# Altium project QKD-LD-001.PrjPcb
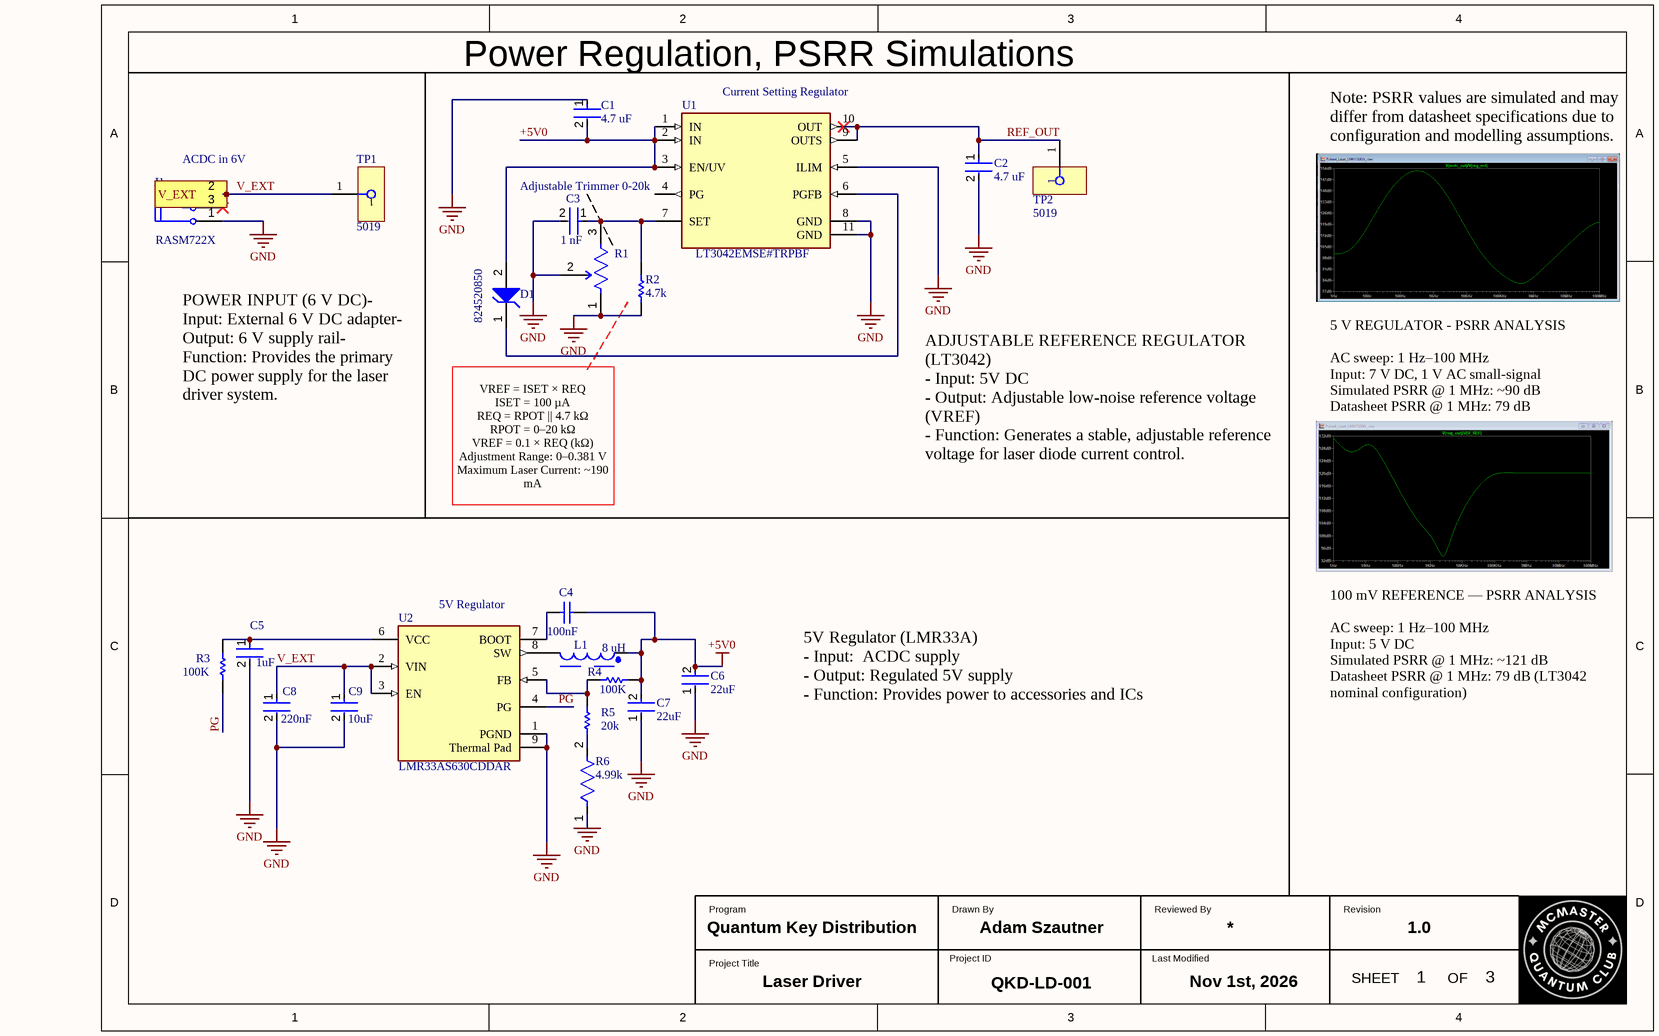
[diagram p0: Power Regulation.SchDoc]
Revision: 1.0; Prj: Laser Driver; Prg: Quantum Key Distribution; PN: QKD-LD-001; LastMod: Nov 1st, 2026; DrawnBy: Adam Szautner
3 sheets, 50 parts. Net scope: global (net labels, ports and power ports of the same name join across sheets).
Sheets:
  Power Regulation.SchDoc
  Pulse Generation.SchDoc
  Peripherals.SchDoc

## Sheet Power Regulation.SchDoc
size A4; DrawnBy: Adam Szautner; Revision: 1.0; SheetNumber: 1; SheetTotal: 3; prg: Quantum Key Distribution; prj: Laser Driver; PN: QKD-LD-001; SPICEModelCacheNLWIOUNF: <root> / <DocumentId>NLWIOUNF</DocumentId> / <CacheFrame Number="0"> / <Model Name="emk325b7475_nht" Kind="CKT"> / <Text>* EMK325B7475_NHT     SPICE MODEL  ( General Type ) / *-------------------------------------------------------------------------------------------------------- / * Model Generated by TAIYO YUDEN Corporation (http://www.ty-top.com) / * Version 1.0 / * TAIYO YUDEN Control No. 170613 / * Copyright(c) 2017 TAIYO YUDEN CO.,LTD. All Rights Reserved. / *-------------------------------------------------------------------------------------------------------- / * / * Products Name : Multilayer Ceramic Capacitors / * / * Characteristics : / *     Capacitance : 4.7 uF , Rated Voltage : 16V , TCC : X7R / *     Case Size : 3.2 x 2.5 / 0.126 x 0.098 [mm/inch] , Thickness : 1.9 / 0.075 [mm/inch] / *     (Conditions: Temperature = 25 degC , DC Bias Current/Voltage = 0A / 0V) / * / * Frequency Range : 40Hz - 3GHz / * / * External Node Assignments : / * / *  1  o---| |---o  2 / * / *-------------------------------------------------------------------------------------------------------- / .SubCkt EMK325B7475_NHT 1 2 / **************************** / C0 1 110 4.4322u / Cm 1 101 0.18549u / C1 101 102 0.5166u / Rc1 101 102 1.212k / C2 102 103 0.23246u / Rc2 102 103 324.4 / C3 103 110 0.044161u / Rc3 103 110 17.632 / C2m 1 301 0.22169u / C21 301 302 1.4263u / Rc21 301 302 2.8865k / C22 302 303 0.94554u / Rc22 302 303 3.6708k / C23 303 304 0.89694u / Rc23 303 304 3.8182k / C24 304 305 0.63775u / Rc24 304 305 327.79 / C25 305 306 0.52201u / Rc25 305 306 313.07 / C26 306 307 0.23625u / Rc26 306 307 60.171 / C27 307 308 0.21382u / Rc27 307 308 30.452 / C28 308 309 0.12573u / Rc28 308 309 51.023 / C29 309 110 4272.8p / Rc29 309 110 13.367 / Rp0 1 110 106.382978723404Meg / L0 110 120 0.15544n / Lm 120 130 0.41806n / L1 120 121 0.46753n / RL1 121 130 0.26517 / L2 120 122 0.47905n / RL2 122 130 0.25841 / L3 120 123 0.81633n / RL3 123 130 40.755 / CR 120 124 1.2488u / LR 124 125 0.3236n / RR 125 130 24.837m / CL 130 140 3.3935p / LL 130 140 0.14146n / RL 130 140 14.873 / Rs 140 2 4.0745m / **************************** / .ends EMK325B7475_NHT</Text> / </Model> / </CacheFrame> / </root>

### Parts
C1  4.7 uF  [FP-1210-L_3_2_0_3-W_2_5_0-MFG]
C2  4.7 uF  [FP-1210-L_3_2_0_3-W_2_5_0-MFG]
C3  1 nF  [FP-0201-L_0_6_0_03-W_0_3-IPC_C]
C4  100nF  [CAPC2013X145X50LL20T20]
C5  1uF  [FP-0402-L_1_0_0_05-W_0_5-IPC_B]
C6  22uF  [FP-GCM32E-0_35-e0_3_1_275-MFG]
C7  22uF  [FP-GCM32E-0_35-e0_3_1_275-MFG]
C8  220nF  [FP-C0603C-CF-MFG]
C9  10uF  [FP-GCJ31C-0_4-IPC_C]
D1  824520850  [WE-TVSP_DO-214AA_Unidirectional]
J1  RASM722X  [SWIT-RASM722X_V]
L1  8 uH  [WE-XHMI_1060 P]
R1  Adjustable Trimmer 0-20k  [FP-3269W-MFG]
R2  4.7k  [RESC1609X50X30NL10T20]
R3  100K  [RESC0603(1608)_N]
R4  100K  [RESC0603(1608)_N]
R5  20k  [RESC3116X65X40ML10T20]
R6  4.99k  [FP-CRCW1210-e3-IPC_B]
TP1  5019  [5019_MFG]
TP2  5019  [5019_MFG]
U1  LT3042EMSE#TRPBF  [FP-MSE-10-05-08-1664-IPC_A]
U2  LMR33AS630CDDAR  [FP-DDA0008J-IPC_B]

### Ports
V_EXT (in)

### Nets
+5V0: C1.2 C4.1 C6.2 C7.2 D1.2(A) L1.1 R4.2 U1.1(IN) U1.2(IN) U1.3(EN/UV)
GND: C1.1 C2.2 C3.2 C5.2 C6.1 C7.1 C8.2 C9.2 J1.1(SLEEVE) R1.1(CCW) R1.2(WIPER) R2.1 R6.1 U1.5(ILIM) U1.8(GND) U1.11(GND) U2.1(PGND) U2.9(Thermal_Pad)
PG: R3.1 U2.4(PG)
REF_OUT: C2.1 TP2.1 U1.9(OUTS) U1.10(OUT)
V_EXT: C8.1 C9.1 J1.2(TIP) TP1.1 U2.2(VIN) U2.3(EN) ; port V_EXT
NetC3_1: C3.1 R1.3(CW) R2.2 U1.7(SET)
NetC4_2: C4.2 U2.7(BOOT)
NetC5_1: C5.1 R3.2 U2.6(VCC)
NetD1_1: D1.1(K) U1.6(PGFB)
NetL1_2: L1.2 U2.8(SW)
NetR4_1: R4.1 R5.2 U2.5(FB)
NetR5_1: R5.1 R6.2

Not connected (* = marked no-connect by the designer): J1 3(SHUNT)*; U1 4(PG)

### Notes on the sheet
- Power Regulation, PSRR Simulations
- (near U1) Current Setting Regulator
- (near J1) ACDC in 6V
- Note: PSRR values are simulated and may differ from datasheet specifications due to configuration and modelling assumptions.
- POWER INPUT (6 V DC)- Input: External 6 V DC adapter- Output: 6 V supply rail- Function: Provides the primary DC power supply for the laser driver system.
- 5 V REGULATOR - PSRR ANALYSIS
  AC sweep: 1 Hz–100 MHz
  Input: 7 V DC, 1 V AC small-signal
  Simulated PSRR @ 1 MHz: ~90 dB
  Datasheet PSRR @ 1 MHz: 79 dB
- VREF = ISET × REQ
  ISET = 100 µA
  REQ = RPOT || 4.7 kΩ
  RPOT = 0–20 kΩ
  VREF = 0.1 × REQ (kΩ)
  Adjustment Range: 0–0.381 V
  Maximum Laser Current: ~190 mA
- ADJUSTABLE REFERENCE REGULATOR (LT3042)
  - Input: 5V DC
  - Output: Adjustable low-noise reference voltage (VREF)
  - Function: Generates a stable, adjustable reference voltage for laser diode current control.
- (near U2) 5V Regulator
- 100 mV REFERENCE — PSRR ANALYSIS
  AC sweep: 1 Hz–100 MHz
  Input: 5 V DC
  Simulated PSRR @ 1 MHz: ~121 dB
  Datasheet PSRR @ 1 MHz: 79 dB (LT3042 nominal configuration)
- 5V Regulator (LMR33A)
  - Input:  ACDC supply
  - Output: Regulated 5V supply
  - Function: Provides power to accessories and ICs
- Program
- Drawn By
- Reviewed By
- Revision
- Project Title
- Project ID
- Last Modified
- SHEET
- OF

### Library data of the parts
C1 C2 = CMP-14477-002952-2: None; RoHS Compliant: Yes
C3 = CMP-14477-001812-1: Ceramic Capacitor General Use 1000pF ±20% 10V X7R 0201
C4 = CMP-2007-01396-1: Part Number: VJ0805Y104JXXPW1BC; Manufacturer: Vitramon
C5 = CMP-14477-002459-2: None
C6 C7 = CMP-06035-055667-1: Ceramic Capacitor for Automotive 22uF ±10% 25VDC X8L 1210 Embossed T/R
C8 = CMP-03020-026996-1: C0603 0.22 μF X7R 30ppm/°C 10.00% 10 V; Manufacturer Part Number: C0603C224K8RAC; Manufacturer: KEMET; Capacitance: 0.22 μF; Automotive Grade: Grade 1; Material: Ceramic; Value: 0.22 μF; Voltage Rating: 10 V; Tolerance: 0.1; Device Class L2: Capacitors; Temperature Range High: +125°C; RoHS: TRUE; Device Class L1: Passive Components; Temperature: -55°C to +125°C; Temperature Coefficient: 30ppm/°C; ComponentLink2Description: Datasheet; Device Class L3: Ceramic Capacitors; ComponentLink2URL: https://api.kemet.com/component-edge/download/datasheet/C0603C100J5GACAUTO.pdf; Category: Cap; Lead Free: Yes; Automotive: Yes; Height: 0.87mm; Temperature Characteristic: X7R; Mouser Description: Multilayer Ceramic Capacitors MLCC - SMD/SMT 50volts 0.22 uF C0G X7R; Octopart: https://octopart.com/c0603c224k8rac-kemet-7455784; Package: C0603C-CF; Temperature Range Low: -55°C
C9 = CMP-06035-004889-1: Cap Ceramic 10uF 35V X7T 10% SMD 1206 +125°C Embossed Plastic T/R
D1 = CMP-03913-71101611-2: Tvs Diode, 600W, 8.5V, Unidir, Do-214Aa; Max Breakdown Voltage: 9.92V; Leakage Current: 20µA; Number of Unidirectional Channels: 1; Polarity: Unidirectional; Peak Pulse Current: 41.7A; Clamping Voltage: 14.4V; Power Line Protection: No; Packaging: Cut Tape; Min Operating Temperature: -65°C; Reverse Standoff Voltage: 8.5V; Max Operating Temperature: 150°C; Composition: Zener; RoHS: Compliant; Width: 3.62mm; Length: 4.32mm; Peak Pulse Power: 600W; Min Breakdown Voltage: 9.92V; REACH SVHC: Unknown; Number of Pins: 2; Mount: Surface Mount; Height: 2.4mm
J1 = CMP-1772-00002-1: Power Jack, 5 A, 250 V, 3-Pin SMD, RoHS, Bulk; ComponentLink1URL: http://www.switchcraft.com/; ComponentLink2URL: http://www.switchcraft.com/Drawings/rasm732x_cd.pdf; ComponentLink1Description: Manufacturer URL; PackageReference: RASM722X; ComponentLink2Description: Datasheet; DatasheetVersion: Rev. A, 09/2005; PackageDescription: 3-Pin Surface Mount Device, Body 14.5 x 9 mm
L1 = CMP-03913-166631046-1: Smd Pwr Ind, 8.2Uh, 19.4A, Shielded/4540 Rohs Compliant: Yes
R1 = CMP-07234-000026-1: TRIMMER 200 OHM 0.25W GW TOP ADJ; Power Rating: 250mW; Temperature Coefficient: 100ppm/°C; Tolerance: 10%; Number of Turns: 12; Resistance: 200R; Packaging: Tape and Reel; Military Standard: Not; Length: 6.35mm; Package Quantity: 1; RoHS Compliant: Yes; Radiation Hardening: No; Height: 0.293inch; Max Power Dissipation: 250mW; Series: Trimpot® 3269 - Sealed; Resistor Type: Cermet; Mount: Surface Mount; Technology: CERMET; Min Operating Temperature: -65°C; Weight: 0.425g; Max Operating Temperature: 150°C; Taper: Linear; Depth: 6.36mm; Width: 0.17inch; Termination: Gull Wing
R2 = CMP-2000-03412-1: Manufacturer: Vishay Dale; Part Number: CRCW06034K70FKTA
R3 R4 = CMP-1012-00736-1: 100K 0.1W 1% 0603 (1608 Metric)  SMD; Value: 100000.00 Ohm; Case-Metric: 1608; Case-EIA: 0603; Power: 0.1 W; Tolerance: 1 %; Technology: SMT
R5 = CMP-2003-04939-1: Part Number: RC1206FR-1320KL; Manufacturer: Yageo
R6 = CMP-2005-00078-2: RES SMD 205K OHM 1% 1/2W 2088; Max Power Dissipation: 500mW; Voltage Rating: 200V; Resistance: 4.99kR; Temperature Coefficient: 100ppm/°C; Case Code (Imperial): 1210; Weight: 0.000564oz; Length: 0.126inch; Case Code (Metric): 3225; Lead Free: Lead Free; Features: Automotive AEC-Q200; Case/Package: 1210; Height: 0.024inch; Number of Terminations: 2; Number of Pins: 2; Composition: Thick Film; Max Operating Temperature: 155°C; Min Operating Temperature: -55°C; Width: 2.5mm; Voltage Rating (DC): 200V; Termination: SMD/SMT; Package Quantity: 1; Power Rating: 500mW; Tolerance: 1%; Packaging: Tape and Reel; Contact Plating: Tin
TP1 TP2 = CMP-1672-00008-3: Phosphor Bronze Contact Miniature Silver Plated Surface Mount Test Points; Number of Contacts: 1; ComponentLink1Description: Manufacturer's Website; Number of Pins: 1; Height: 2.42mm; Mount: Surface Mount; HelpURL: https://www.keyelco.com/product-pdf.cfm?p=1357; REACH SVHC: Yes; Packaging: Tape and Reel; Lead Free: Lead Free; ComponentLink1URL: http://www.keyelco.com/; Termination: SMD/SMT; Material: Bronze; Contact Plating: Silver; Contact Material: Silver; RoHS: Compliant; ComponentLink2URL: https://www.keyelco.com/product-pdf.cfm?p=1357; China RoHS: Compliant; Lifecycle Status: Production; ComponentLink2Description: Datasheet URL
U1 = CMP-09138-000250-1: IC REG LIN POS ADJ 200MA 10MSOP; Dropout Voltage: 350mV; Number of Regulators: 1; Output Voltage: 15V; Min Current Limit: 220mA; Output Current: 200mA; Series: -; Packaging: Tape and Reel; Mount: Surface Mount; RoHS Compliant: Yes; Max Operating Temperature: 125°C; Number of Pins: 10; Case/Package: MSOP; Min Operating Temperature: -40°C
U2 = CMP-04918-000348-1: IC REG BUCK ADJUSTABLE 3A 8SOPWR; Synchronous Rectifier: Yes; Number of Outputs: 1; Min Output Voltage: 1V; Switching Frequency: 2.1MHz; Max Output Voltage: 24V; Output Configuration: Positive; Max Input Voltage: 36V; Min Input Voltage: 3.8V; Max Operating Temperature: 125°C; Mount: Surface Mount; Min Operating Temperature: -40°C; Number of Pins: 8; Output Current: 3A; RoHS Compliant: Yes; Output Type: Adjustable; Packaging: Tape and Reel

## Sheet Pulse Generation.SchDoc
size A4; SheetNumber: 2; SheetTotal: 3
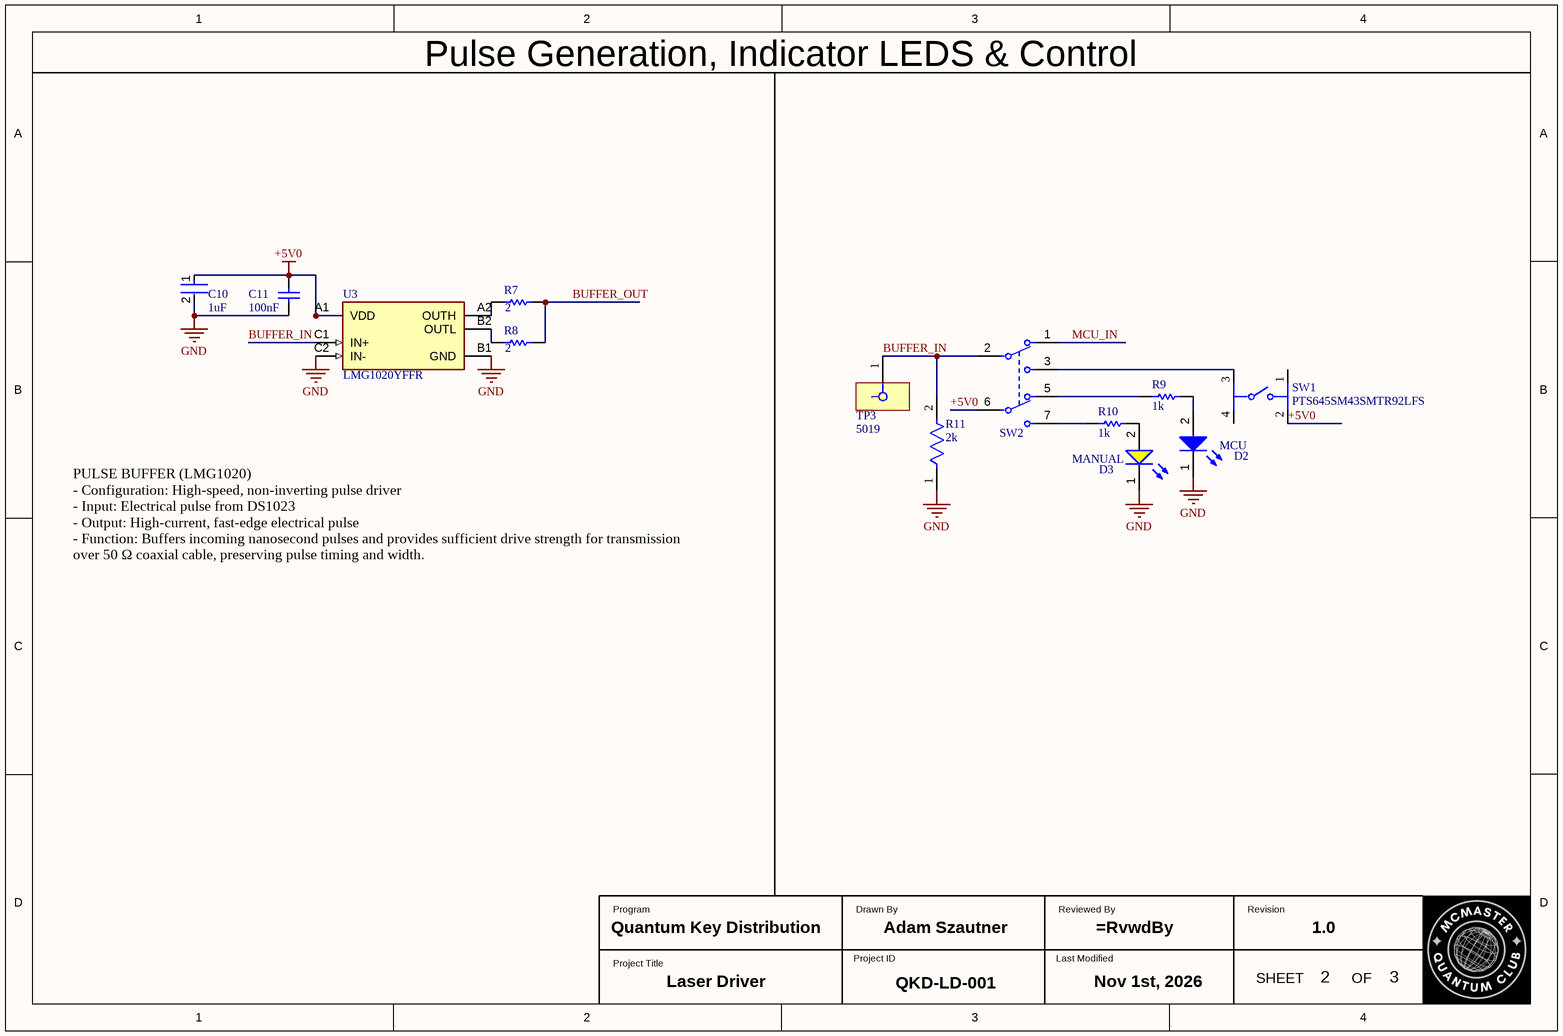
[diagram p1: Pulse Generation.SchDoc]

### Parts
C10  1uF  [FP-1206-L_3_2_0_15-W_1_6-IPC_A]
C11  100nF  [CAPC2013X145X50LL20T20]
D2  MCU  [WL-SMCW_0805_150080xx75000]
D3  MANUAL  [WL-SMCW_0805_150080xx75000]
R7  2  [RESC1005X40X25NL05T10]
R8  2  [RESC1005X40X25NL05T10]
R9  1k  [RESC2013X60X35ML10T20]
R10  1k  [RESC2013X60X35ML10T20]
R11  2k  [FP-TFCR1206-IPC_B]
SW1  PTS645SM43SMTR92LFS  [PTS645SM43SMTR92LFS_MFG]
SW2  JS202011JCQN  [FP-JS202011JCQN-MFG]  (value not drawn)
TP3  5019  [5019_MFG]
U3  LMG1020YFFR  [FP-YFF0006-MFG]

### Nets
+5V0: C10.1 C11.2 SW1.2 SW2.6(2_C) U3.A1(VDD)
GND: C10.2 C11.1 D2.1(K) D3.1(K) R11.1 U3.B1(GND) U3.C2(IN-)
BUFFER_IN: R11.2 SW2.2(1_C) TP3.1 U3.C1(IN+)
BUFFER_OUT: R7.2 R8.2
MCU_IN: SW2.1
NetD2_2: D2.2(A) R9.2
NetD3_2: D3.2(A) R10.2
NetR7_1: R7.1 U3.A2(OUTH)
NetR8_1: R8.1 U3.B2(OUTL)
NetR9_1: R9.1 SW2.5
NetR10_1: R10.1 SW2.7
NetSW1_3: SW1.3 SW2.3

Not connected (* = marked no-connect by the designer): SW1 1 4

### Notes on the sheet
- Pulse Generation, Indicator LEDS & Control
- PULSE BUFFER (LMG1020)
  - Configuration: High-speed, non-inverting pulse driver
  - Input: Electrical pulse from DS1023
  - Output: High-current, fast-edge electrical pulse
  - Function: Buffers incoming nanosecond pulses and provides sufficient drive strength for transmission over 50 Ω coaxial cable, preserving pulse timing and width.
- Program
- Drawn By
- Reviewed By
- Revision
- Project Title
- Project ID
- Last Modified
- SHEET
- OF

### Library data of the parts
C10 = CMP-14477-003123-2: None
C11 = CMP-2007-01396-1: as C4 on sheet Power Regulation
D2 = CMP-1426-00008-9: Wurth Elektronik Blue LED, WL-SMCW Series, 0805 (2012), 470nm, 2x1.25x0.7mm; Manufacturer Lifecycle Status: ACTIVE; Manufacturer Package Identifier: 0805 (2012 metric); YEOL: 1 = Estimated lifetime > 10 years; Peak Wavelength: 465nm; Reverse Voltage: 5V; Lens Style: Clear, Rectangular; Luminous Intensity: 145mcd; Power Dissipation: 105mW; Test Current: 20mA; Viewing Angle: 140°; Forward Voltage: 3.2V; Max Junction Temperature (Tj): 95°C; Forward Current: 100mA; Length: 2mm; Width: 1.25mm; Min Operating Temperature: -40°C; Color: Blue; Packaging: Tape and Reel; Lifecycle Status: Production; Height: 700µm; REACH SVHC: Unknown; Case Code (Imperial): 0805; Mount: Surface Mount; Dominant Wavelength: 470nm; Wavelength: 470nm; Lead Free: Lead Free; Case/Package: 0805; Max Reverse Voltage (DC): 5V; Case Code (Metric): 2012; RoHS: Compliant; Max Operating Temperature: 85°C
D3 = CMP-1426-00012-5: 2 V Yellow LED 2012 (0805) SMD, Wurth Elektronik WL-SMCW 150080YS75000; Manufacturer Lifecycle Status: ACTIVE; Manufacturer Package Identifier: 0805 (2012 metric); YEOL: 1 = Estimated lifetime > 10 years; Dominant Wavelength: 590nm; Forward Voltage: 2V; Forward Current: 100mA; Test Current: 20mA; Max Junction Temperature (Tj): 95°C; Reverse Voltage: 5V; Viewing Angle: 140°; Lens Style: Clear, Rectangular; Peak Wavelength: 595nm; Power Dissipation: 72mW; Luminous Intensity: 120mcd; REACH SVHC: Unknown; Width: 1.25mm; Height: 700µm; RoHS: Compliant; Wavelength: 590nm; Length: 2mm; Mount: Surface Mount; Max Operating Temperature: 85°C; Min Operating Temperature: -40°C; Case Code (Imperial): 0805; Case Code (Metric): 2012; Max Reverse Voltage (DC): 5V; Packaging: Tape and Reel; Color: Yellow; Lifecycle Status: Production; Case/Package: 0805
R7 R8 = CMP-2002-07592-1: Manufacturer: Yageo; Part Number: RC0402FR-072R15L
R9 R10 = CMP-2100-03671-1: Chip Resistor, 1 KOhm, +/- 1%, 125 mW, -55 to 155 degC, 0805 (2012 Metric), RoHS, Tape and Reel; Manufacturer: Yageo; Temperature Coefficient: 100ppm/degreesC; Voltage Rating (DC): 150V; Max Power Dissipation: 125mW; Resistance: 1KOhm; Number of Pins: 2; Number of Terminations: 2; Datasheet URL: http://www.yageo.com/NewPortal/yageodocoutput?fileName=/pdf/R-Chip/PYu-RC_Group_51_RoHS_L_5.pdf; Length: 0.079inch; Package Description: 2-Pin Surface Mounted Device, Body 2 x 1.25 mm; Depth: 1.25mm; Height: 0.024inch; Military Standard: Not; Case/Package: 0805; Package Reference: 0805; RoHSCompliant: true; Lead Free: LeadFree; Packaging: TapeandReel; Package Quantity: 1; Datasheet Version: Rev. 5, 10/2016; Tolerance: 1%; Min Operating Temperature: -55degC; Voltage Rating: 150V; Composition: ThickFilm; Case Code (Imperial): 0805; Power Rating: 125mW; Width: 0.049inch; Case Code (Metric): 2012; Manufacturer URL: http://www.yageo.com/; Max Operating Temperature: 155degC; REACH SVHC: Unknown; Termination: SMD/SMT
R11 = CMP-250906-277321-1: RES Thin Film, 2kΩ, 0.1%, 0.25W, 25ppm/°C, 1206
SW1 = CMP-2000-05160-3: Switch Tactile N.O SPST Round Button Gull Wing 0.05A 12VDC 100000Cycle 1.57N SMD T/R; Switch Function: Off-Mom; Life (Cycles): 100kcycles; Voltage Rating (DC): 12V; Actuator Material: Nylon, Polyamide; Max Current Rating: 50mA; Contact Resistance: 100mΩ; Number of Positions: 1; Actuator Length: 850µm; Illumination Type: Illuminated, Non-Illuminated; Insulation Resistance: 100GΩ; RoHS: Compliant; Electrical Life: 100kcycles; Lead Free: Lead Free; Contact Plating: Silver; Case/Package: SMD/SMT; Termination: Solder; Height: 3.45mm; Manufacturer Package Identifier: PTS645SM43SMTR92LFS; ComponentLink1URL: http://www.ck-components.com/; Max Voltage Rating (DC): 12V; Lifecycle Status: Production; Min Operating Temperature: -20°C; Throw Configuration: SPST; China RoHS: Compliant; ComponentLink1Description: Manufacturer's Website; Operating Force: 1.57N; Depth: 9mm; Contact Material: Silver; Length: 6mm; Current Rating: 50mA; Color: Black; Contact Current Rating: 50mA; Mechanical Life: 100kcycles; ComponentLink2URL: https://www.ckswitches.com/media/1471/pts645.pdf; Orientation: Straight; Packaging: Cut Tape (CT); REACH SVHC: Yes; Max Operating Temperature: 60°C; ComponentLink2Description: Datasheet URL; HelpURL: https://www.ckswitches.com/media/1471/pts645.pdf; Mount: Surface Mount
SW2 = CMP-10038-000009-1: SWITCH SLIDE DPDT 300MA 6V; Actuator Material: Nylon; Actuator Length: 2mm; Actuator Type: Standard; Electrical Life: 5000Cycles; Switch Function: On-On; Mount: Surface Mount; Current Rating: 300mA; Contact Material: Copper Alloy; Voltage Rating (DC): 6V; Throw Configuration: DPDT; Packaging: Cut Tape; Contact Plating: Silver; Min Operating Temperature: -40°C; Switch Travel: 2mm; Max Operating Temperature: 85°C
TP3 = CMP-1672-00008-3: as TP1 on sheet Power Regulation; ComponentLink1Description: Manufacturer's Website; Number of Pins: 1; Height: 2.42mm; Mount: Surface Mount; HelpURL: https://www.keyelco.com/product-pdf.cfm?p=1357; REACH SVHC: Yes; Packaging: Tape and Reel; Lead Free: Lead Free; ComponentLink1URL: http://www.keyelco.com/; Termination: SMD/SMT; Material: Bronze; Contact Plating: Silver; Contact Material: Silver; RoHS: Compliant; ComponentLink2URL: https://www.keyelco.com/product-pdf.cfm?p=1357; China RoHS: Compliant; Lifecycle Status: Production; ComponentLink2Description: Datasheet URL
U3 = CMP-04912-000016-1: IC GATE DRVR LOW-SIDE 6DSBGA; Manufacturer: Texas Instruments; Fall Time: 400ps; Number Of Outputs: 1; Min Supply Voltage: 4.75V; Standoff Height: 0.12mm; Nominal Supply Current: 40-51mA; Max Supply Voltage: 5.4V; Output Current: 7A; Max Junction Temp: +125°C; Propagation Delay: 2.5ns; Category: IC; Rise Time: 400ps; Temperature: -40°C to +125°C; Number Of Drivers: 1; RoHS: TRUE; Lead Free: Yes; ComponentLink2URL: http://www.ti.com/lit/ds/symlink/lmg1020.pdf; Mouser Description: 5V, 7A/5A low side GaN driver with 60MHz/1ns speed 6-DSBGA -40 to 125; Temperature Range Low: -40°C; Device Class L1: Integrated Circuits (ICs); Device Class L3: Gate Drivers; Automotive: No; Manufacturer Part Number: LMG1020YFFR; Device Class L2: Power Management ICs; Height: 0.625mm; Temperature Range High: +125°C; Octopart: https://octopart.com/lmg1020yffr-texas+instruments-89917478; Ipc Land Pattern Name: BGA6N40P2X3_125X85X62; ComponentLink2Description: Datasheet; Package: YFF0006; Digikey Description: IC GATE DRVR LOW-SIDE 6DSBGA

## Sheet Peripherals.SchDoc
size A4; SheetNumber: 3; SheetTotal: 3
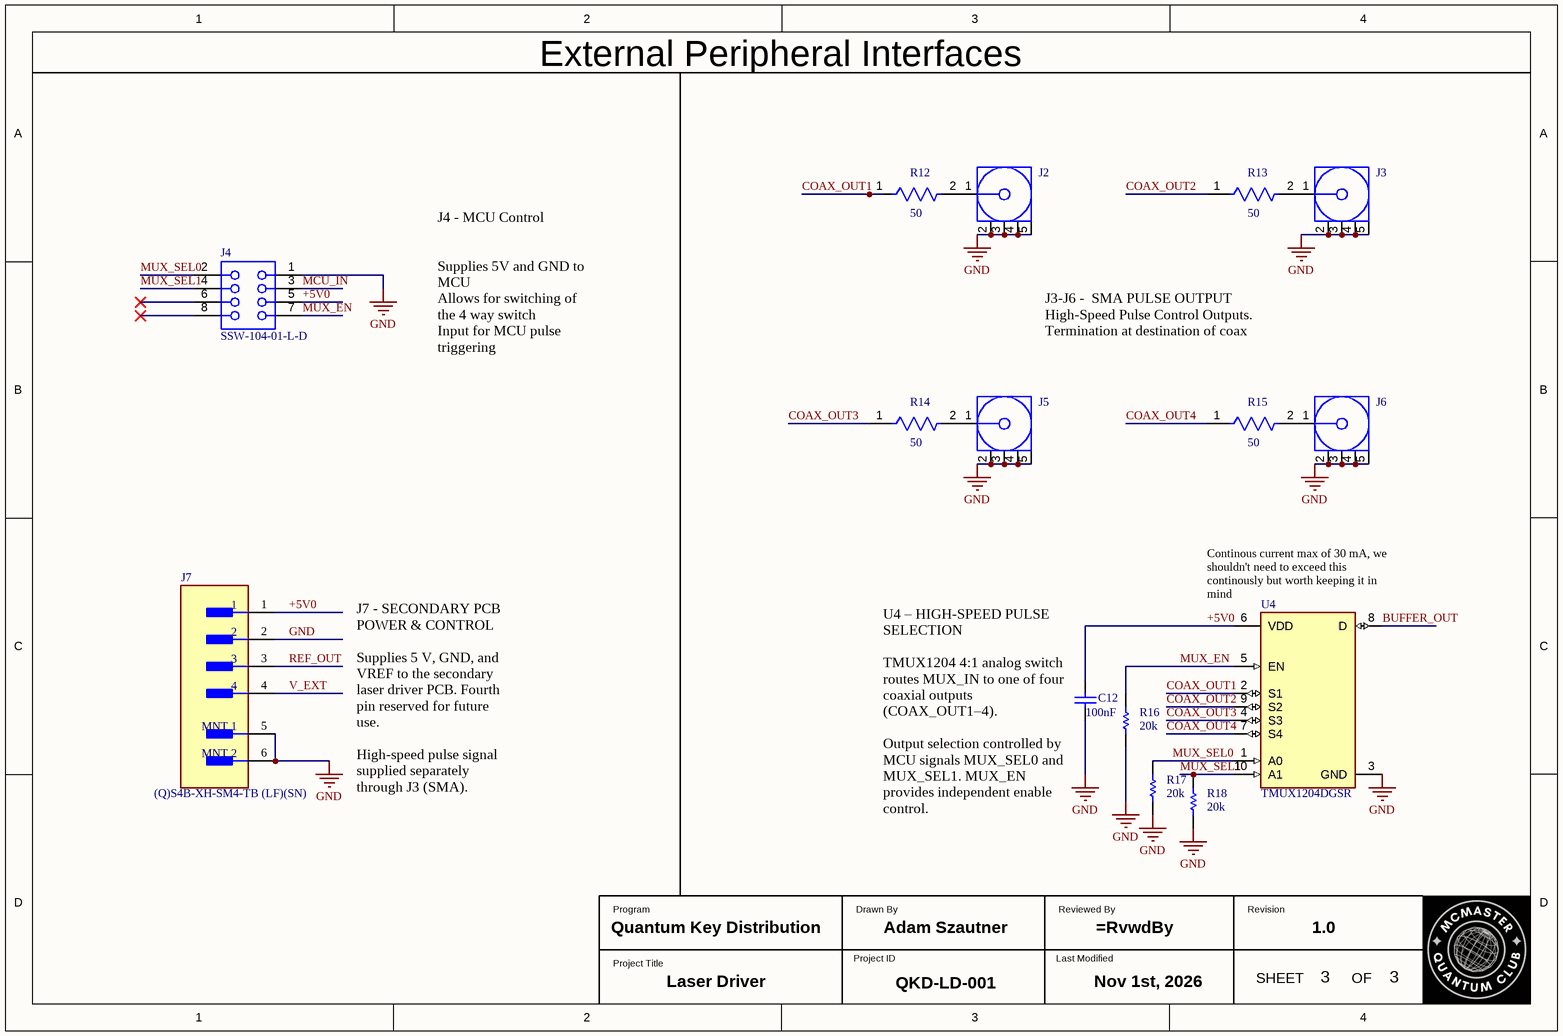
[diagram p2: Peripherals.SchDoc]

### Parts
C12  100nF  [CAPC2013X145X50LL20T20]
J2  60312242114510  [60312242114510]  (value not drawn)
J3  60312242114510  [60312242114510]  (value not drawn)
J4  SSW-104-01-L-D  [SMTC-SSW-104-01-X-D]
J5  60312242114510  [60312242114510]  (value not drawn)
J6  60312242114510  [60312242114510]  (value not drawn)
J7  (Q)S4B-XH-SM4-TB (LF)(SN)  [FP-Q_S4B-XH-SM4-TB_LF-MFG]
R12  50  [FP-CRCW0603-e3-MFG]
R13  50  [FP-CRCW0603-e3-MFG]
R14  50  [FP-CRCW0603-e3-MFG]
R15  50  [FP-CRCW0603-e3-MFG]
R16  20k  [RESC3116X65X40ML10T20]
R17  20k  [RESC3116X65X40ML10T20]
R18  20k  [RESC3116X65X40ML10T20]
U4  TMUX1204DGSR  [FP-DGS0010A-MFG]

### Nets
+5V0: C12.1 J4.5 J7.1 U4.6(VDD)
GND: C12.2 J2.2(GND) J2.3(GND) J2.4(GND) J2.5(GND) J3.2(GND) J3.3(GND) J3.4(GND) J3.5(GND) J4.1 J5.2(GND) J5.3(GND) J5.4(GND) J5.5(GND) J6.2(GND) J6.3(GND) J6.4(GND) J6.5(GND) J7.2 J7.5(MNT_1) J7.6(MNT_2) R16.1 R17.1 R18.1 U4.3(GND)
BUFFER_OUT: U4.8(D)
COAX_OUT1: R12.1 U4.2(S1)
COAX_OUT2: R13.1 U4.9(S2)
COAX_OUT3: R14.1 U4.4(S3)
COAX_OUT4: R15.1 U4.7(S4)
MCU_IN: J4.3
MUX_EN: J4.7 R16.2 U4.5(EN)
MUX_SEL0: J4.2 R17.2 U4.1(A0)
MUX_SEL1: J4.4 R18.2 U4.10(A1)
REF_OUT: J7.3
V_EXT: J7.4
NetJ2_1: J2.1(Signal) R12.2
NetJ3_1: J3.1(Signal) R13.2
NetJ5_1: J5.1(Signal) R14.2
NetJ6_1: J6.1(Signal) R15.2

Not connected (* = marked no-connect by the designer): J4 6* 8*

### Notes on the sheet
- External Peripheral Interfaces
- Type @ to refer to a designator
- J3-J6 -  SMA PULSE OUTPUT
  High-Speed Pulse Control Outputs.
  Termination at destination of coax
- J4 - MCU Control
  Supplies 5V and GND to MCU
  Allows for switching of the 4 way switch
  Input for MCU pulse triggering
- (near U4) Continous current max of 30 mA, we shouldn't need to exceed this continously but worth keeping it in mind
- J7 - SECONDARY PCB POWER & CONTROL
  Supplies 5 V, GND, and VREF to the secondary laser driver PCB. Fourth pin reserved for future use.
  High-speed pulse signal supplied separately through J3 (SMA).
- (near C12) U4 – HIGH-SPEED PULSE SELECTION
  TMUX1204 4:1 analog switch routes MUX_IN to one of four coaxial outputs (COAX_OUT1–4).
  Output selection controlled by MCU signals MUX_SEL0 and MUX_SEL1. MUX_EN provides independent enable control.
- Program
- Drawn By
- Reviewed By
- Revision
- Project Title
- Project ID
- Last Modified
- SHEET
- OF

### Library data of the parts
C12 = CMP-2007-01396-1: as C4 on sheet Power Regulation
J2 J3 J5 J6 = CMP-03913-97004434-3: Rf Coax Conn, Sma Jack, 50 Ohm, Pcb Rohs Compliant: Yes; Insertion Loss (dB): 0.14dB; Impedance: 50Ω; Insulation Resistance: 5GΩ; Orientation: Straight; Connector Type: SMA; Max Operating Temperature: 165°C; Insulation Material: PTFE; Min Operating Temperature: -65°C
J4 = CMP-1023-00337-1: SQ Post Socket, Through-hole, Vertical, -55 to 125 degC, 2.54mm Pitch, 8-Pin, Female, RoHS; Manufacturer: Samtec; ComponentLink3URL: http://www.samtec.com/documents/webfiles/cpdf/SSW-1XX-XX-XXX-X-XX-XXX-XX-MKT.pdf; Orientation: Vertical; ComponentLink2Description: Datasheet; Temperature Range: -55 to 125 degC; PackageDescription: Assembly, Socket Strip .016 X .031 Tail; RoHS: True; ComponentLink1Description: Manufacturer URL; ComponentLink2URL: http://www.samtec.com/documents/webfiles/pdf/SSW_TH.PDF; ComponentLink1URL: http://www.samtec.com; PartNumber: SSW-104-01-L-D; DatasheetVersion: F-214; Pitch: 2.54 mm; ComponentLink3Description: Package Specification; PackageReference: SSW-104-01-X-D; PackageVersion: CA, 6/1987; Mounting Technology: Through-hole
J7 = CMP-17439-000477-1: CONN HEADER SMD R/A 4POS 2.5MM
R12-R15 = CMP-2000-03436-2: RES Thick Film, 50Ω, 1%, 0.1W, 100ppm/°C, 0603; Voltage Rating (DC): 75V; Resistance: 50R; Power Rating: 100mW; Case/Package: 0603; Packaging: Tape and Reel; Military Standard: Not; REACH SVHC: No SVHC; Width: 0.85mm; Max Operating Temperature: 155°C; Case Code (Metric): 1608; Temperature Coefficient: 100ppm/°C; Lead Free: Lead Free; Height: 0.45mm; Composition: Thick Film; Termination: SMD/SMT; Contact Plating: Tin; Number of Pins: 2; Tolerance: 1%; Depth: 0.85mm; Weight: 7.1E-05oz; Min Operating Temperature: -55°C; Length: 1.55mm; Radiation Hardening: No; Voltage Rating: 75V; Case Code (Imperial): 0603; Package Quantity: 5000; Mount: Surface Mount
R16-R18 = CMP-2003-04939-1: as R5 on sheet Power Regulation
U4 = CMP-04892-000013-1: MULTIPLEXER; Manufacturer: Texas Instruments; Max Junction Temp: +150°C; Mux Demux Ratio: 4:1; Nominal Supply Current: 0.01uA; Max Supply Voltage: 5.5V; Standoff Height: 0.05mm; Number Of Circuits: 1; Min Supply Voltage: 1.08V; On State Resistance: 5Ω; Throw Configuration: SP4T; -3Db Bandwith: 125MHz; Device Class L1: Integrated Circuits (ICs); Package: DGS0010A; Category: IC; Device Class L3: Multiplexers; Temperature Range Low: -40°C; Automotive: No; Mouser Description: 5-V 4: 1 general-purpose analog multiplexer 10-VSSOP -40 to 125; Lead Free: Yes; Octopart: https://octopart.com/tmux1204dgsr-texas+instruments-101015770; Temperature Range High: +125°C; Ambient Temperature Range Low: -40°C; ComponentLink2URL: http://www.ti.com/lit/ds/symlink/tmux1204.pdf; Ambient Temperature Range High: +125°C; ComponentLink2Description: Datasheet; Height: 1.1mm; Device Class L2: Interface ICs; RoHS: TRUE; Digikey Description: MULTIPLEXER; Temperature: -40°C to +125°C; Manufacturer Part Number: TMUX1204DGSR

## Nets that join several sheets
+5V0: Power Regulation (10 pins), Pulse Generation (5 pins), Peripherals (C12.1 J4.5 J7.1 U4.6)
GND: Power Regulation (18 pins), Pulse Generation (7 pins), Peripherals (25 pins)
BUFFER_OUT: Pulse Generation (R7.2 R8.2), Peripherals (U4.8)
MCU_IN: Pulse Generation (SW2.1), Peripherals (J4.3)
REF_OUT: Power Regulation (C2.1 TP2.1 U1.9 U1.10), Peripherals (J7.3)
V_EXT: Power Regulation (6 pins), Peripherals (J7.4)